# Altium schematic sheet Sheet1.SchDoc
size A; SheetNumber: 1; SheetTotal: 1
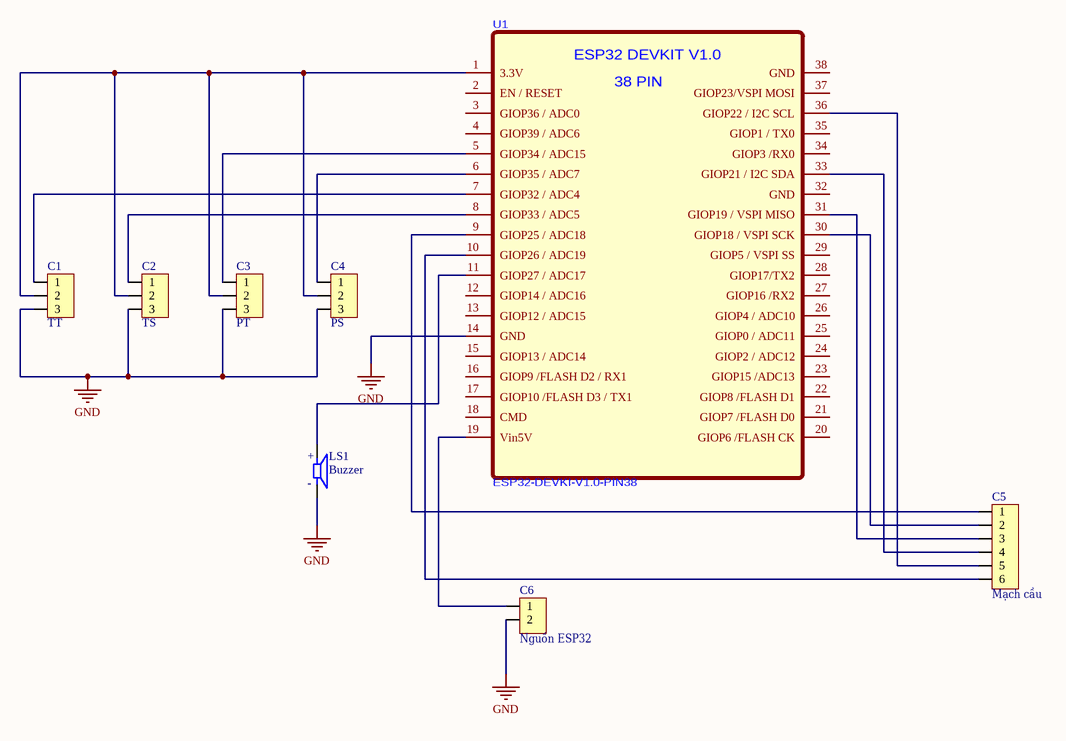
[diagram p0: Sheet1.SchDoc]

## Parts
C1  TT  [HDR3]
C2  TS  [HDR3]
C3  PT  [HDR3]
C4  PS  [HDR3]
C5  Mạch cầu  [HDR6]
C6  Nguồn ESP32  [HDR2]
LS1  Buzzer  [Buzzer-12MM]
U1  ESP32-DEVKI-V1.0-PIN38  [ESP32-DEVKIT-V1.0-38PIN]

## Nets
GND: C1.3 C2.3 C3.3 C4.3 C6.2 LS1.2(M) U1.14(GND)
NetC1_1: C1.1 U1.7(GIOP32_/_ADC4)
NetC1_2: C1.2 C2.2 C3.2 C4.2 U1.1(3.3V)
NetC2_1: C2.1 U1.8(GIOP33_/_ADC5)
NetC3_1: C3.1 U1.5(GIOP34_/_ADC15)
NetC4_1: C4.1 U1.6(GIOP35_/_ADC7)
NetC5_1: C5.1 U1.9(GIOP25_/_ADC18)
NetC5_2: C5.2 U1.30(GIOP18_/_VSPI_SCK)
NetC5_3: C5.3 U1.31(GIOP19_/_VSPI_MISO)
NetC5_4: C5.4 U1.33(GIOP21_/_I2C_SDA)
NetC5_5: C5.5 U1.36(GIOP22_/_I2C_SCL)
NetC5_6: C5.6 U1.10(GIOP26_/_ADC19)
NetC6_1: C6.1 U1.19(Vin5V)
NetLS1_1: LS1.1(P) U1.11(GIOP27_/_ADC17)

Not connected (* = marked no-connect by the designer): U1 2(EN_/_RESET) 3(GIOP36_/_ADC0) 4(GIOP39_/_ADC6) 12(GIOP14_/_ADC16) 13(GIOP12_/_ADC15) 15(GIOP13_/_ADC14) 16(GIOP9_/FLASH_D2_/_RX1) 17(GIOP10_/FLASH_D3_/_TX1) 18(CMD) 20(GIOP6_/FLASH_CK) 21(GIOP7_/FLASH_D0) 22(GIOP8_/FLASH_D1) 23(GIOP15_/ADC13) 24(GIOP2_/_ADC12) 25(GIOP0_/_ADC11) 26(GIOP4_/_ADC10) 27(GIOP16_/RX2) 28(GIOP17/TX2) 29(GIOP5_/_VSPI_SS) 32(GND) 34(GIOP3_/RX0) 35(GIOP1_/_TX0) 37(GIOP23/VSPI_MOSI) 38(GND)

## Notes on the sheet
- (in symbol Buzzer) +; -
- (in symbol ESP32-DEVKI-V1.0-PIN38) ESP32 DEVKIT V1.0; 38 PIN

## Library data of the parts
C1-C4 = Header3: Header IDC, 3 x 1 Pin Vertical 2.54mm Pitch (Non-Boxed, Male); Manufacturer: W¨¹rth Elektronik eiSos GmbH; partNo: 613002143121; ComponentLink1 Description: Manufacturer; ComponentLink2 Description: Datasheet; NoPins: 02; Created Date: 29 March 2013; ComponentLink1URL: http://www.we-online.com; ComponentLink2URL: http://katalog.we-online.de/em/datasheet/6130xx143121.pdf; Created by: Karrer Zheng
C5 = Header6: Header IDC, 6 x 1 Pin Vertical 2.54mm Pitch (Non-Boxed, Male); Manufacturer: W¨¹rth Elektronik eiSos GmbH; partNo: 613002143121; ComponentLink1 Description: Manufacturer; ComponentLink2 Description: Datasheet; NoPins: 02; Created Date: 29 March 2013; ComponentLink1URL: http://www.we-online.com; ComponentLink2URL: http://katalog.we-online.de/em/datasheet/6130xx143121.pdf; Created by: Karrer Zheng
C6 = Header2: Header IDC, 2 x 1 Pin Vertical 2.54mm Pitch (Non-Boxed, Male); Manufacturer: W¨¹rth Elektronik eiSos GmbH; partNo: 613002143121; ComponentLink1 Description: Manufacturer; ComponentLink2 Description: Datasheet; NoPins: 02; Created Date: 29 March 2013; ComponentLink1URL: http://www.we-online.com; ComponentLink2URL: http://katalog.we-online.de/em/datasheet/6130xx143121.pdf; Created by: Karrer Zheng
LS1 = Buzzer: MP: CST-951AP; Availability: Unavailable; Price: None; Value: *; Package: None